# Altium schematic sheet Power Supply.SchDoc
size 254 x 203 mm
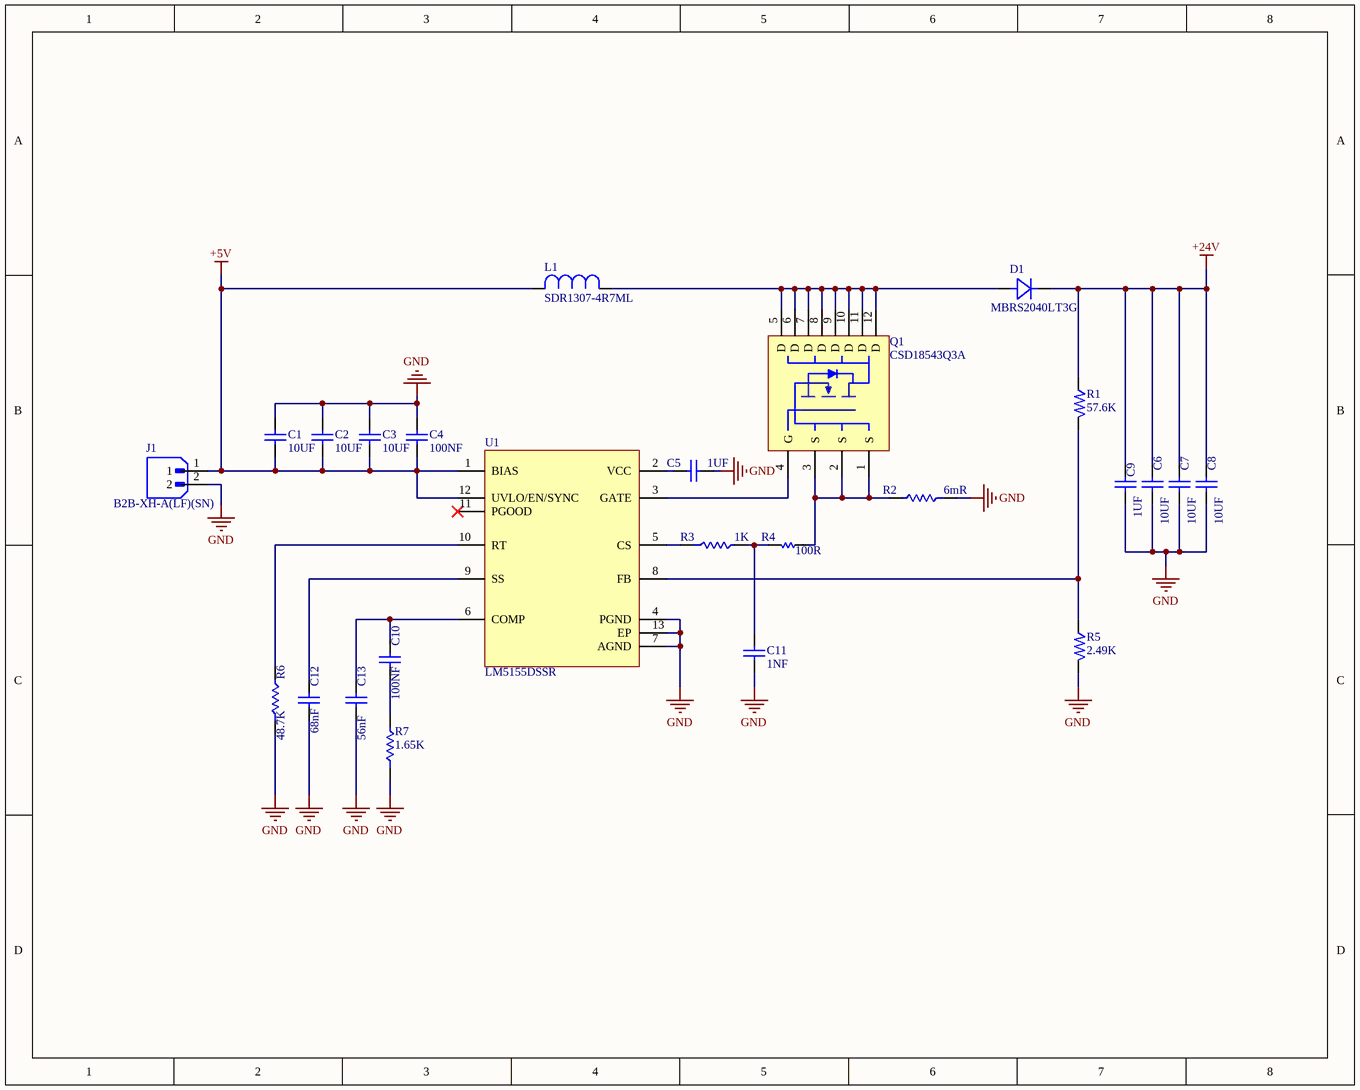
[diagram p0: Power Supply.SchDoc]

## Parts
C1  10UF  [CAP 0805/2012]
C2  10UF  [CAP 0805/2012]
C3  10UF  [CAP 0805/2012]
C4  100NF  [CAP 0402/1005]
C5  1UF  [CAP 0805/2012]
C6  10UF  [CAP 0805/2012]
C7  10UF  [CAP 0805/2012]
C8  10UF  [CAP 0805/2012]
C9  1UF  [CAP 0805/2012]
C10  100NF  [CAP 0402/1005]
C11  1NF  [CAP 0603/1608]
C12  68nF  [CAP 0603/1608]
C13  56nF  [CAP 0603/1608]
D1  MBRS2040LT3G  [CR_40LT3G_ONS]
J1  B2B-XH-A(LF)(SN)  [JST_B2B-XH-A]
L1  SDR1307-4R7ML  [IND_BOURNS_SDR1307]
Q1  CSD18543Q3A  [TRANS_CSD18543Q3A]
R1  57.6K  [CAP 0603/1608]
R2  6mR  [CAP 1206/3216]
R3  1K  [CAP 0603/1608]
R4  100R  [CAP 0402/1005]
R5  2.49K  [CAP 0603/1608]
R6  48.7K  [CAP 0603/1608]
R7  1.65K  [CAP 0603/1608]
U1  LM5155DSSR  [IC_LM5155DSSR]

## Nets
+5V: C1.1 C2.1 C3.1 C4.1 J1.1 L1.2 U1.1(BIAS) U1.12(UVLO/EN/SYNC)
+24V: C6.2 C7.2 C8.2 C9.2 D1.1 R1.1
GND: C1.2 C2.2 C3.2 C4.2 C5.2 C6.1 C7.1 C8.1 C9.1 C11.1 C12.1 C13.1 J1.2 R2.1 R5.2 R6.1 R7.1 U1.4(PGND) U1.7(AGND) U1.13(EP)
NetC5_1: C5.1 U1.2(VCC)
NetC10_1: C10.1 R7.2
NetC10_2: C10.2 C13.2 U1.6(COMP)
NetC11_2: C11.2 R3.2 R4.1
NetC12_2: C12.2 U1.9(SS)
NetD1_2: D1.2 L1.1 Q1.5(D) Q1.6(D) Q1.7(D) Q1.8(D) Q1.9(D) Q1.10(D) Q1.11(D) Q1.12(D)
NetQ1_1: Q1.1(S) Q1.2(S) Q1.3(S) R2.2 R4.2
NetQ1_4: Q1.4(G) U1.3(GATE)
NetR1_2: R1.2 R5.1 U1.8(FB)
NetR3_1: R3.1 U1.5(CS)
NetR6_2: R6.2 U1.10(RT)

Not connected (* = marked no-connect by the designer): U1 11(PGOOD)*

## Library data of the parts
C1-C3 C6-C8 = 10UF: CAP CER 10uF 50V X5R 0805; Manufacturer: muRata; MPN: GRM21BR61H106KE43L; SPN: C440198; Value: 10UF; Package: 0805; Supplier: LCSC; Operating Temperature: -55°C ~ 125°C
C4 C10 = 100NF: 50V 100nF X7R ±10% 0402 Multilayer Ceramic Capacitors MLCC - SMD/SMT ROHS; Manufacturer: muRata; MPN: GRM155R71H104KE14D; Value: 2.2nF; SPN: C77020; Package: 0402 (1005 Metric); Supplier: LCSC; Operating Temperature: -55°C ~ 125°C
C5 C9 = 1UF: CAP CER 1uF 50V X7R 0805; Manufacturer: Samsung Electro-Mechanics; Manufacturer Part Number: CL21B105KBFNNNE; Value: 1UF; Package: 0805; Supplier: LCSC; Supplier Part Number: C28323
C11 = 1NF: CAP CER 1nF 50V X7R 0603; Manufacturer: Samsung Electro-Mechanics; MPN: CL10B102KB8NNNC; SPN: C1588; Value: 1NF; Package: 0603; Supplier: LCSC; Operating Temperature: -55°C ~ 125°C
C12 = 68nF: CAP CER 68nF 50V X7R 0603; Manufacturer: YAGEO; Manufacturer Part Number: CC0603KRX7R9BB683; Value: 68NF; Package: 0603; Supplier: LCSC; Supplier Part Number: C107098
C13 = 56nF: CAP CER 56nF 50V X7R 0603; Manufacturer: YAGEO; Manufacturer Part Number: CC0603KRX7R9BB563; Value: 56nF; Package: 0603; Supplier: LCSC; Supplier Part Number: C282072
D1 = MBRS2040LT3G: DIODE SCHOTTKY 40V SMB(DO-214AA); Manufacturer_Name: onsemi; SPN: C59626; Manufacturer_Part_Number: MBRS2040LT3G; Package: SMB(DO-214AA)
J1 = B2B-XH-A: Through Hole,P=2.5mm; MF: JST; SPN: C158012; Value: B2B-XH-A(LF)(SN); MP: B2B-XH-A(LF)(SN)
L1 = SDR1307-4R7ML: FIXED IND 4.7uH 7A 10mΩ SMD,13x13mm; Manufacturer: Bourns Electronics; Package: SMD,13x13mm; Manufacturer_Part_Number: SDR1307-4R7ML; LCSC: C2046624
Q1 = CSD18543Q3A: 60-V, N channel NexFETâ„¢ power MOSFET, single SON 3 mm x 3 mm, 9.9 mOhm; MF: Texas Instruments; SPN: C840100; Package: VSONP-8; Value: CSD18543Q3A; MPN: CSD18543Q3A
R1 = 57.6K: RES 57.6kΩ ±1% 100mW 0603; Manufacturer: YAGEO; MPN: RC0603FR-0757K6L; SPN: C245983; Package: 0603; Value: 57.6K; Supplier: LCSC; Operating Temperature: -55°C ~ 155°C; Supplier Availability: Active
R2 = 6mR: RES 6mΩ ±1% 1W 1206; Manufacturer: prosemi; Manufacturer Part Number: MSR12A1R006F2; Package: 1206; Supplier: LCSC; Supplier Part Number: C21261095; Temperature: -55 to 155; Value: 6mR
R3 = 1K-0603: RES 1kΩ ±1% 100mW 0603; Manufacturer: YAGEO; Manufacturer Part Number: RC0603FR-071KL; Package: 0603; Supplier Part Number: C22548; Value: 1K; Supplier: LCSC; Operating Temperature: -55°C ~ 155°C; Supplier Availability: Active
R4 = 100R/0402: RES 100Ω ±1% 62.5mW 0402; Manufacturer Part Number: RC0402FR-07100RL; Manufacturer: Yageo; package: 0402; Supplier: LCSC; Supplier Part Number: C106232; Temperature: -55 to 155; value: 100R
R5 = 2.49K: RES 2.49kΩ ±1% 100mW 0603; Manufacturer: FOJAN; MPN: FRC0603F2491TS; SPN: C2930072; Package: 0603; Value: 2.49K; Supplier: LCSC; Operating Temperature: -55°C ~ 155°C; Supplier Availability: Active
R6 = 48.7K: RES 48.7kΩ ±1% 100mW 0603; Manufacturer: FOJAN; Manufacturer Part Number: FRC0603F4872TS; Package: 0603; Supplier Part Number: C2933226; Value: 48.7K; Supplier: LCSC; Operating Temperature: -55°C ~ 155°C; Supplier Availability: Active
R7 = 1.65K: RES 1.65kΩ ±1% 100mW 0603; Manufacturer: FOJAN; Manufacturer Part Number: FRC0603F1651TS; Package: 06-3; Supplier Part Number: C2930051; Value: 1.65K; Supplier: LCSC; Operating Temperature: -55°C ~ 155°C; Supplier Availability: Active
U1 = LM5155DSSR: 2.2-MHz wide VIN, 1.5-A MOSFET driver, non-synchronous boost controller; SPN: C545416; MF: Texas Instruments; Package: WSON-12 Texas Instruments; Value: LM5155DSSR; MPN: LM5155DSSR